# Altium project GTV3.5_Board.PrjPcb (part 12 of 12)

## Sheet Heater_Section.SchDoc
size 420 x 297 mm; DocumentNumber: 11; SheetNumber: 11; SheetTotal: 17
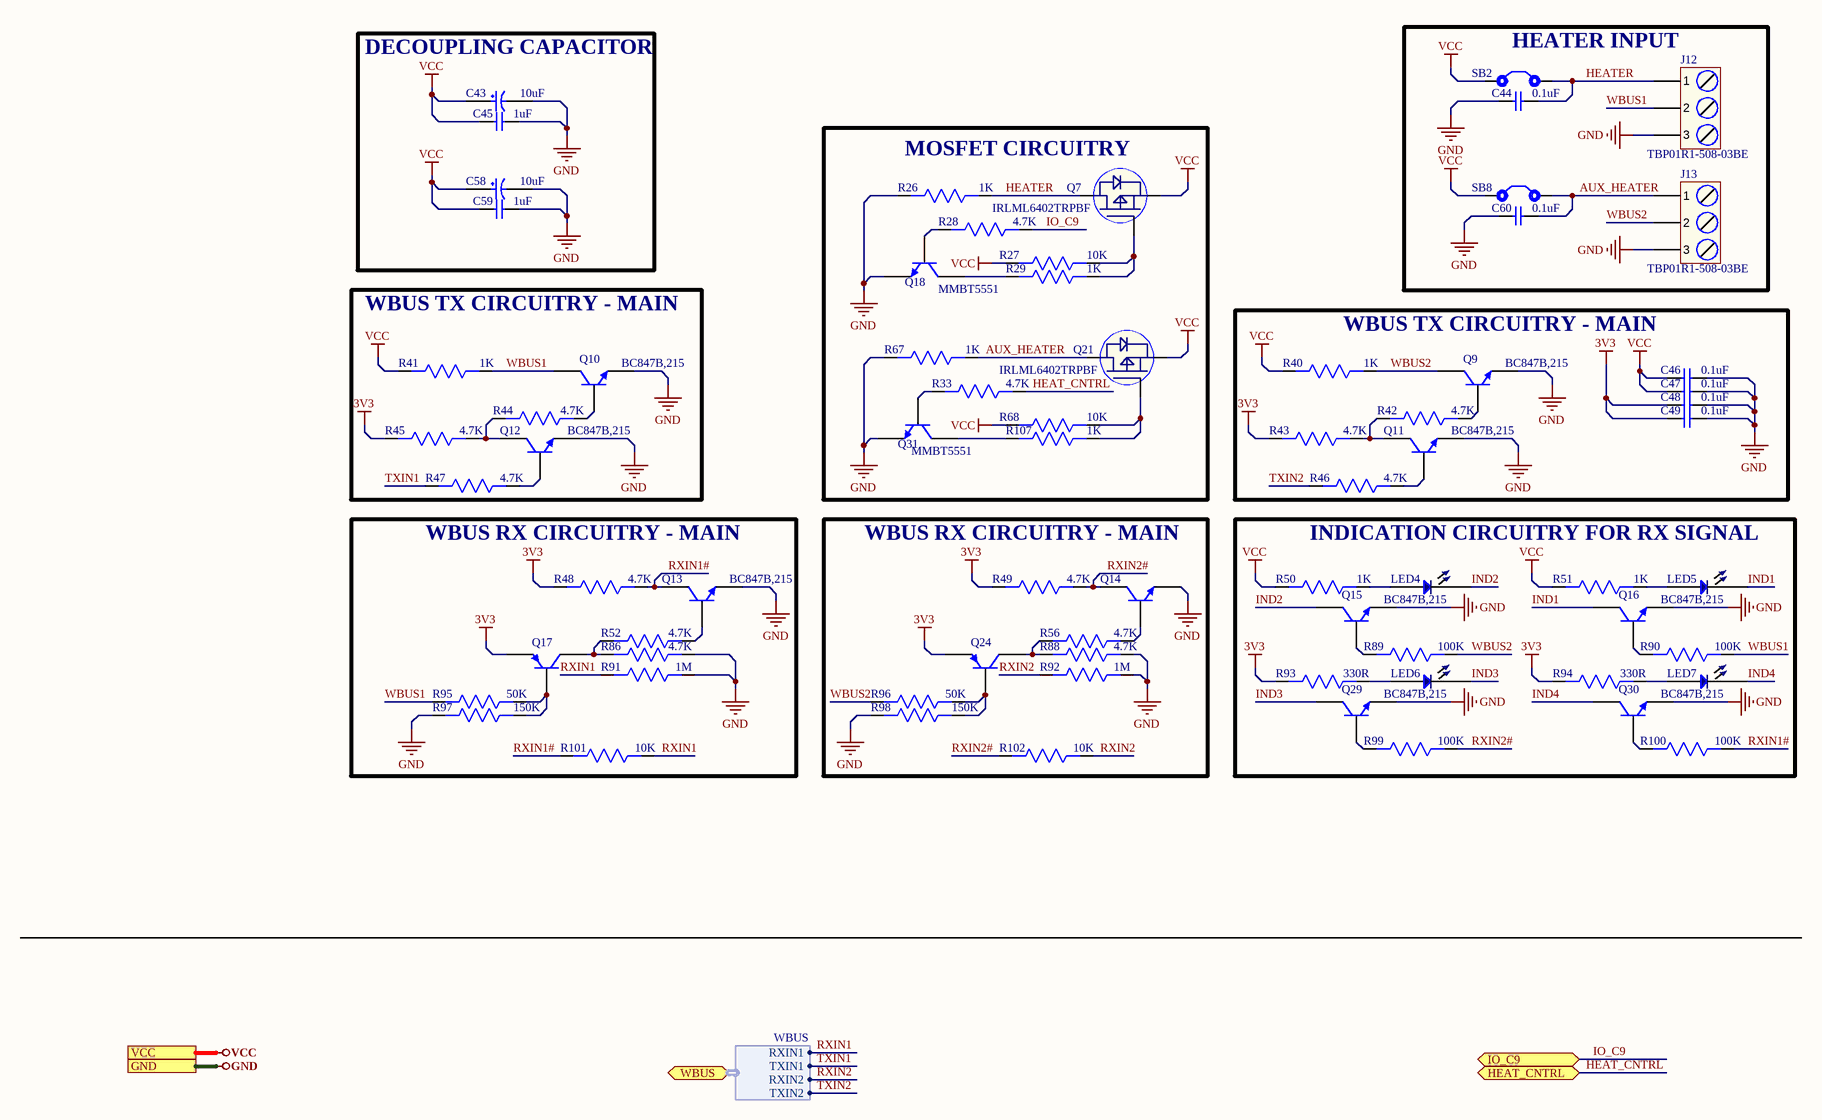
[diagram p21: Heater_Section.SchDoc]

### Parts
C43  10uF  [RVT1E100M0405.]
C44  0.1uF  [Cap0603]
C45  1uF  [Cap0603]
C46  0.1uF  [Cap0603]
C47  0.1uF  [Cap0603]
C48  0.1uF  [Cap0603]
C49  0.1uF  [Cap0603]
C58  10uF  [RVT1E100M0405.]
C59  1uF  [Cap0603]
C60  0.1uF  [Cap0603]
J12  TBP01R1-508-03BE  [TBP01R1-508-03BE]
J13  TBP01R1-508-03BE  [TBP01R1-508-03BE]
LED4  XZMDK68W-2  [LED 0402]  (value not drawn)
LED5  XZMDK68W-2  [LED 0402]  (value not drawn)
LED6  XZMDK68W-2  [LED 0402]  (value not drawn)
LED7  XZMDK68W-2  [LED 0402]  (value not drawn)
Q7  IRLML6402TRPBF  [SOT-23]
Q9  BC847B,215  [SOT-23]
Q10  BC847B,215  [SOT-23]
Q11  BC847B,215  [SOT-23]
Q12  BC847B,215  [SOT-23]
Q13  BC847B,215  [SOT-23]
Q14  BC847B,215  [SOT-23]  (value not drawn)
Q15  BC847B,215  [SOT-23]
Q16  BC847B,215  [SOT-23]
Q17  BC857C,215  [SOT-23]  (value not drawn)
Q18  MMBT5551  [SOT-23]
Q21  IRLML6402TRPBF  [SOT-23]
Q24  BC857C,215  [SOT-23]  (value not drawn)
Q29  BC847B,215  [SOT-23]
Q30  BC847B,215  [SOT-23]
Q31  MMBT5551  [SOT-23]
R26  1K  [RES-0603]
R27  10K  [Res-0603]
R28  4.7K  [RES-0603]
R29  1K  [Res-0603]
R33  4.7K  [RES-0603]
R40  1K  [RES-0603]
R41  1K  [RES-0603]
R42  4.7K  [RES-0603]
R43  4.7K  [RES-0603]
R44  4.7K  [RES-0603]
R45  4.7K  [RES-0603]
R46  4.7K  [RES-0603]
R47  4.7K  [RES-0603]
R48  4.7K  [RES-0603]
R49  4.7K  [RES-0603]
R50  1K  [RES-0603]
R51  1K  [RES-0603]
R52  4.7K  [RES-0603]
R56  4.7K  [RES-0603]
R67  1K  [RES-0603]
R68  10K  [Res-0603]
R86  4.7K  [RES-0603]
R88  4.7K  [RES-0603]
R89  100K  [RES-0603]
R90  100K  [RES-0603]
R91  1M  [RES-0603]
R92  1M  [RES-0603]
R93  330R  [Res-0603]
R94  330R  [Res-0603]
R95  50K  [RES 0805]
R96  50K  [RES 0805]
R97  150K  [RES-0603]
R98  150K  [RES-0603]
R99  100K  [RES-0603]
R100  100K  [RES-0603]
R101  10K  [Res-0603]
R102  10K  [Res-0603]
R107  1K  [Res-0603]
SB2  Solder Bridge  [Solder Bridge]  (value not drawn)
SB8  Solder Bridge  [Solder Bridge]  (value not drawn)

### Blocks framed on the sheet
DECOUPLING CAPACITOR: C43 C45 C58 C59
HEATER INPUT: C44 C60 J12 J13 SB2 SB8
MOSFET CIRCUITRY: Q7 Q18 Q21 Q31 R26-R29 R33 R67 R68 R107
WBUS TX CIRCUITRY - MAIN: Q10 Q12 R41 R44 R45 R47
WBUS TX CIRCUITRY - MAIN: C46-C49 Q9 Q11 R40 R42 R43 R46
WBUS RX CIRCUITRY - MAIN: Q13 Q17 R48 R52 R86 R91 R95 R97 R101
WBUS RX CIRCUITRY - MAIN: Q14 Q24 R49 R56 R88 R92 R96 R98 R102
INDICATION CIRCUITRY FOR RX SIGNAL: LED4-LED7 Q15 Q16 Q29 Q30 R50 R51 R89 R90 R93 R94 R99 R100

### Ports
GND, HEAT_CNTRL (bidir), IO_C9 (bidir), VCC, WBUS (bidir, harness WBUS)

### Harnesses
WBUS: RXIN1, TXIN1, RXIN2, TXIN2

### Nets
3V3: C48.1 C49.1 Q17.2(E) Q24.2(E) R43.2 R45.2 R48.2 R49.2 R93.2 R94.2
GND: C43.2 C44.1 C45.2 C46.2 C47.2 C48.2 C49.2 C58.2 C59.2 C60.1 J12.3 J13.3 Q9.2(E) Q10.2(E) Q11.2(E) Q12.2(E) Q13.2(E) Q14.2(E) Q15.2(E) Q16.2(E) Q18.2(E) Q29.2(E) Q30.2(E) Q31.2(E) R26.2 R67.2 R86.1 R88.1 R91.1 R92.1 R97.2 R98.2 ; port GND
VCC: C43.1 C45.1 C46.1 C47.1 C58.1 C59.1 Q7.2(S) Q21.2(S) R27.2 R40.2 R41.2 R50.2 R51.2 R68.2 SB2.1 SB8.1 ; port VCC
AUX_HEATER: C60.2 J13.1 Q21.3(D) R67.1 SB8.2
HEAT_CNTRL: R33.1 ; port HEAT_CNTRL
HEATER: C44.2 J12.1 Q7.3(D) R26.1 SB2.2
IND1: LED5.2 Q16.3(C)
IND2: LED4.2 Q15.3(C)
IND3: LED6.2 Q29.3(C)
IND4: LED7.2 Q30.3(C)
IO_C9: R28.1 ; port IO_C9
RXIN1: R91.2 R101.1 ; port WBUS.RXIN1
RXIN1#: Q13.3(C) R48.1 R100.1 R101.2
RXIN2: R92.2 R102.1 ; port WBUS.RXIN2
RXIN2#: Q14.3(C) R49.1 R99.1 R102.2
TXIN1: R47.2 ; port WBUS.TXIN1
TXIN2: R46.2 ; port WBUS.TXIN2
WBUS1: J12.2 Q10.3(C) R41.1 R90.1 R95.2
WBUS2: J13.2 Q9.3(C) R40.1 R89.1 R96.2
NetLED4_1: LED4.1 R50.1
NetLED5_1: LED5.1 R51.1
NetLED6_1: LED6.1 R93.1
NetLED7_1: LED7.1 R94.1
NetQ7_1: Q7.1(G) R27.1 R29.1
NetQ9_1: Q9.1(B) R42.1
NetQ10_1: Q10.1(B) R44.1
NetQ11_1: Q11.1(B) R46.1
NetQ11_3: Q11.3(C) R42.2 R43.1
NetQ12_1: Q12.1(B) R47.1
NetQ12_3: Q12.3(C) R44.2 R45.1
NetQ13_1: Q13.1(B) R52.1
NetQ14_1: Q14.1(B) R56.1
NetQ15_1: Q15.1(B) R89.2
NetQ16_1: Q16.1(B) R90.2
NetQ17_1: Q17.1(B) R95.1 R97.1
NetQ17_3: Q17.3(C) R52.2 R86.2
NetQ18_1: Q18.1(B) R28.2
NetQ18_3: Q18.3(C) R29.2
NetQ21_1: Q21.1(G) R68.1 R107.1
NetQ24_1: Q24.1(B) R96.1 R98.1
NetQ24_3: Q24.3(C) R56.2 R88.2
NetQ29_1: Q29.1(B) R99.2
NetQ30_1: Q30.1(B) R100.2
NetQ31_1: Q31.1(B) R33.2
NetQ31_3: Q31.3(C) R107.2

### Notes on the sheet
- File:
- Title:
- Date:
- Page
- Num:
- Total:
- Drawn By: Huzaifa Ali

### Library data of the parts
C43 C58 = RVT1E100M0405: CAP ALUM 10uF 25V SMD; Manufacturer: ROQANG; φD: 4mm; L: 5.4mm; Tolerance: ±20%; Operating Temperature: -45℃~+105℃; Rated Voltage: 25V; Capacitance: 10uF
C44 C46-C49 C60 = CC0603ZRY5V9BB104: as C37 on sheet Switch_Sheet; Supplier 1: Digi-Key; Manufacturer Part Number: CC0603ZRY5V9BB104; Stock 1: 15000880; Pricing 1: 1=0.1, 10=0.075, 100=0.0334, 500=0.02386, 1000=0.01874 (USD); Mount: Surface Mount; Case/Package: 0603; Number of Pins: 2; Case Code (Metric): 1608; Case Code (Imperial): 0603; Min Operating Temperature: -30°C; Max Operating Temperature: 85°C; Dielectric: Y5V; Voltage Rating: 50V; Package Quantity: 1; Packaging: Tape and Reel; Voltage Rating (DC): 50V; Termination: SMD/SMT; Composition: Ceramic; Voltage: 50V; Length: 1.6mm; Height: 0.8mm; Width: 0.031inch; Thickness: 0.035inch; Depth: 0.8mm; Radiation Hardening: No; REACH SVHC: No SVHC; Lead Free: Lead Free; Halogen Free: Halogen Free; ComponentLink1URL: http://www.yageo.com/documents/recent/UPY-GPHC_Y5V_6.3V-to-50V_8.pdf?src-supplier=Digi-Key; ComponentLink1Description: http://www.yageo.com/documents/recent/UPY-GPHC_Y5V_6.3V-to-50V_8.pdf?src-supplier=Digi-Key; ComponentLink2URL: http://www.yageo.com/documents/recent/UPY-GPHC_Y5V_6.3V-to-50V_5.pdf?src-supplier=Avnet+Europe; ComponentLink2Description: http://www.yageo.com/documents/recent/UPY-GPHC_Y5V_6.3V-to-50V_5.pdf?src-supplier=Avnet+Europe; ComponentLink3URL: https://www.verical.com/server-webapp/html/getDatasheet?partID=403611&src-supplier=Verical; ComponentLink3Description: https://www.verical.com/server-webapp/html/getDatasheet?partID=403611&src-supplier=Verical; ComponentLink4URL: http://www.mouser.com/ds/2/447/Yageo_UPY-GP_NP0_16V-to-50V_9-358835.pdf?src-supplier=Mouser; ComponentLink4Description: http://www.mouser.com/ds/2/447/Yageo_UPY-GP_NP0_16V-to-50V_9-358835.pdf?src-supplier=Mouser; ComponentLink5URL: http://www.farnell.com/datasheets/1132289.pdf?src-supplier=Element14; ComponentLink5Description: http://www.farnell.com/datasheets/1132289.pdf?src-supplier=Element14; Supplier Part Number 1: 311-1343-1-ND
C45 C59 = CC0603KRX5R8BB105: CAP CER 1UF 25V X5R 0603; Manufacturer: Yageo; Tolerance: 10%; Supplier 1: Digi-Key; Manufacturer Part Number: CC0603KRX5R8BB105; Stock 1: 1419041; Pricing 1: 1=0.1, 10=0.069, 100=0.0307, 500=0.0219, 1000=0.0172 (USD); Mount: Surface Mount; Case/Package: 0603; Number of Pins: 2; Case Code (Metric): 1608; Case Code (Imperial): 0603; Min Operating Temperature: -55°C; Max Operating Temperature: 85°C; Capacitance: 1uF; Dielectric: X5R; Package Quantity: 1; Voltage Rating: 25V; Packaging: Tape and Reel; Termination: SMD/SMT; Voltage Rating (DC): 25V; Length: 1.6mm; Height: 0.8mm; Width: 0.031inch; Thickness: 0.035inch; Depth: 0.8mm; Radiation Hardening: No; REACH SVHC: No SVHC; Lead Free: Lead Free; Halogen Free: Halogen Free; ComponentLink1URL: http://www.yageo.com/documents/recent/UPY-GPHC_X5R_4V-to-50V_25.pdf?src-supplier=Digi-Key; ComponentLink1Description: http://www.yageo.com/documents/recent/UPY-GPHC_X5R_4V-to-50V_25.pdf?src-supplier=Digi-Key; ComponentLink2URL: http://www.yageo.com/documents/recent/UPY-GPHC_X5R_4V-to-50V_12.pdf?src-supplier=Avnet+Europe; ComponentLink2Description: http://www.yageo.com/documents/recent/UPY-GPHC_X5R_4V-to-50V_12.pdf?src-supplier=Avnet+Europe; ComponentLink3URL: http://www.farnell.com/datasheets/1525783.pdf?src-supplier=Element14; ComponentLink3Description: http://www.farnell.com/datasheets/1525783.pdf?src-supplier=Element14; ComponentLink4URL: http://www.yageo.com/documents/recent/UPY-GPHC_X5R_4V-to-50V_12.pdf?src-supplier=Avnet; ComponentLink4Description: http://www.yageo.com/documents/recent/UPY-GPHC_X5R_4V-to-50V_12.pdf?src-supplier=Avnet; Supplier Part Number 1: 311-1445-6-ND
J12 J13 = TBP01R1-508-03BE: TERMINAL BLOCK, PLUGGABLE, 5.08,; Manufacturer: CUI Devices; Supplier 1: Arrow Electronics; Manufacturer Part Number: TBP01R1-508-03BE; RoHS: Yes; Category: Terminal Blocks; Stock 1: 2069; Pricing 1: 1=0.52380, 10=0.21370, 100=0.18450, 600=0.17070 (USD); Supplier Part Number 1: TBP01R1-508-03BE
LED4-LED7 = XZMDK68W-2: LED RED CLEAR CHIP SMD; Manufacturer: SunLED; Lens Color: Colorless; Luminous Intensity: 69mcd; Test Current: 20mA; Viewing Angle: 120°; Dominant Wavelength: 630nm; Forward Voltage: 1.95V; Supplier 1: Digi-Key; Manufacturer Part Number: XZMDK68W-2; Stock 1: 69539; Pricing 1: 1=0.43, 10=0.306, 100=0.136, 500=0.0952, 1000=0.0782 (USD); Mount: Surface Mount; Case/Package: 0402; Color: Red; Case Code (Metric): 1005; Case Code (Imperial): 0402; Packaging: Tape and Reel; Lens Transparency: Clear; Length: 1mm; Height: 0.6mm; Width: 0.5mm; ComponentLink1URL: http://www.sunledusa.com/products/spec/XZMDK68W-2.pdf?src-supplier=Digi-Key; ComponentLink1Description: http://www.sunledusa.com/products/spec/XZMDK68W-2.pdf?src-supplier=Digi-Key; ComponentLink2URL: https://www.sunledusa.com/products/spec/XZMDK68W-2.pdf?src-supplier=Digi-Key; ComponentLink2Description: https://www.sunledusa.com/products/spec/XZMDK68W-2.pdf?src-supplier=Digi-Key; Supplier Part Number 1: 1497-1174-6-ND
Q7 Q21 = IRLML6402TRPBF: MOSFET P-CH 20V 3.7A SOT23; Manufacturer: International Rectifier; Rise Time: 48ns; Gate to Source Voltage (Vgs): 12V; Turn-On Delay Time: 350ns; Turn-Off Delay Time: 588ns; Fall Time: 381ns; Nominal Vgs: -550mV; Rds On Max: 65mR; Input Capacitance: 633pF; Max Power Dissipation: 1.3W; Number of Elements: 1; Dual Supply Voltage: -20V; Element Configuration: Single; Current Rating: -3.7A; Supplier 1: Newark; Manufacturer Part Number: IRLML6402TRPBF; RoHS: Yes; Category: MOSFETs; Mount: Surface Mount; Case/Package: SOT-23; Number of Pins: 3; Min Operating Temperature: -55°C; Max Operating Temperature: 150°C; Drain to Source Voltage (Vdss): 20V; Continuous Drain Current (ID): 3.7A; Package Quantity: 1; Packaging: Tape and Reel; Drain to Source Resistance: 65mR; Power Dissipation: 1.3W; Threshold Voltage: -550mV; Termination: SMD/SMT; Drain to Source Breakdown Voltage: -20V; Voltage Rating (DC): -20V; On-State Resistance: 65mR; Series: HEXFET®; Drain-source On Resistance-Max: 65mR; Length: 3.04mm; Width: 1.4mm; Height: 1.02mm; Radiation Hardening: No; Lead Free: Lead Free; RoHS Compliant: Yes; REACH SVHC: No SVHC; ComponentLink1URL: https://datasheet.ciiva.com/7799/13209-7799017.pdf?src-supplier=Element14; ComponentLink1Description: https://datasheet.ciiva.com/7799/13209-7799017.pdf?src-supplier=Element14; ComponentLink2URL: https://datasheet.ciiva.com/34302/1563729-34302500.pdf?src-supplier=Jameco; ComponentLink2Description: https://datasheet.ciiva.com/34302/1563729-34302500.pdf?src-supplier=Jameco; ComponentLink3URL: https://datasheet.ciiva.com/28515/irlml6402pbf-28515795.pdf?src-supplier=Element14; ComponentLink3Description: https://datasheet.ciiva.com/28515/irlml6402pbf-28515795.pdf?src-supplier=Element14; ComponentLink4URL: https://datasheet.ciiva.com/7333/irlml6402-7333200.pdf?src-supplier=Newark; ComponentLink4Description: https://datasheet.ciiva.com/7333/irlml6402-7333200.pdf?src-supplier=Newark; ComponentLink5URL: https://datasheet.ciiva.com/29326/162833-da-01-en-irlml-6402tr-29326798.pdf?src-supplier=Conrad; ComponentLink5Description: https://datasheet.ciiva.com/29326/162833-da-01-en-irlml-6402tr-29326798.pdf?src-supplier=Conrad; ComponentLink6URL: https://datasheet.ciiva.com/7799/13209-7799018.pdf?src-supplier=Element14; ComponentLink6Description: https://datasheet.ciiva.com/7799/13209-7799018.pdf?src-supplier=Element14; ComponentLink7URL: https://datasheet.ciiva.com/936/irlml6402pbf-936987.pdf?src-supplier=Digi-Key; ComponentLink7Description: https://datasheet.ciiva.com/936/irlml6402pbf-936987.pdf?src-supplier=Digi-Key; ComponentLink8URL: https://datasheet.ciiva.com/936/irlml6402pbf-936988.pdf?src-supplier=Digi-Key; ComponentLink8Description: https://datasheet.ciiva.com/936/irlml6402pbf-936988.pdf?src-supplier=Digi-Key; ComponentLink9URL: https://datasheet.ciiva.com/16311/irlml6402pbf-16311535.pdf?src-supplier=Future+Electronics; ComponentLink9Description: https://datasheet.ciiva.com/16311/irlml6402pbf-16311535.pdf?src-supplier=Future+Electronics; Supplier Part Number 1: 06X2796
Q9-Q16 Q29 Q30 = BC847B,215: NPN Ic=100mA Vceo=45V hfe=200~450 P=250mW; Manufacturer: Nexperia; Supplier 1: Arrow Electronics; Manufacturer Part Number: BC847B,215; RoHS: Yes; Category: BJTs; Stock 1: 29122; Pricing 1: 1=0.09880, 10=0.09780, 25=0.08510, 100=0.03610, 250=0.03050, 500=0.03020, 1000=0.01780, 3000=0.01760, 15000=0.01740 (USD); RoHS Compliant: Yes; ComponentLink1URL: http://www.farnell.com/datasheets/1856333.pdf?src-supplier=Farnell; ComponentLink1Description: http://www.farnell.com/datasheets/1856333.pdf?src-supplier=Farnell; ComponentLink2URL: https://assets.nexperia.com/documents/data-sheet/BC847_SER.pdf?src-supplier=Digi-Key; ComponentLink2Description: https://assets.nexperia.com/documents/data-sheet/BC847_SER.pdf?src-supplier=Digi-Key; ComponentLink3URL: http://www.farnell.com/datasheets/1856333.pdf?src-supplier=Newark; ComponentLink3Description: http://www.farnell.com/datasheets/1856333.pdf?src-supplier=Newark; Supplier Part Number 1: BC847B,215
Q17 Q24 = BC857C,215: PNP Ic=-100mA Vceo=-45V hfe=420~800 P=250mW; Manufacturer: Nexperia; Supplier 1: Arrow Electronics; Manufacturer Part Number: BC857C,215; RoHS: Yes; Stock 1: 72007; Pricing 1: 1=0.10380, 10=0.09690, 25=0.09560, 100=0.06510, 250=0.04590, 500=0.03870, 1000=0.02580, 3000=0.01620, 15000=0.01600, 30000=0.01420 (USD); RoHS Compliant: Yes; ComponentLink1URL: http://www.farnell.com/datasheets/490737.pdf?src-supplier=Farnell; ComponentLink1Description: http://www.farnell.com/datasheets/490737.pdf?src-supplier=Farnell; ComponentLink2URL: https://assets.nexperia.com/documents/data-sheet/BC856_BC857_BC858.pdf?src-supplier=Digi-Key; ComponentLink2Description: https://assets.nexperia.com/documents/data-sheet/BC856_BC857_BC858.pdf?src-supplier=Digi-Key; ComponentLink3URL: http://www.semiconductors.philips.com/acrobat/datasheets/BC856_BC857_BC858_6.pdf?src-supplier=Newark; ComponentLink3Description: http://www.semiconductors.philips.com/acrobat/datasheets/BC856_BC857_BC858_6.pdf?src-supplier=Newark; Supplier Part Number 1: BC857C,215
Q18 Q31 = MMBT5551: TRANS NPN 160V 0.6A SOT-23; Manufacturer: ON Semiconductor; Manufacturer Part Number: MMBT5551LT1G; Max Power Dissipation: 225mW; Max Collector Current: 600mA; Collector Base Voltage (VCBO): 180V; Emitter Base Voltage (VEBO): 6V; Element Configuration: Single; hFE Min: 80; Power Dissipation: 300mW; Number of Elements: 1; Collector Emitter Saturation Voltage: 150mV; Collector-emitter Voltage-Max: 200mV; Supplier 1: Digi-Key; RoHS: Yes; Category: BJTs; Pricing 1: 1=0.22000, 10=0.17700, 100=0.09370, 500=0.06162, 1000=0.04190 (USD); Case/Package: SOT-23-3; Number of Pins: 3; Weight: 0.01lb; Contact Plating: Tin,Matte; Min Operating Temperature: -55°C; Max Operating Temperature: 150°C; Packaging: Tape and Reel; Collector Emitter Voltage (VCEO): 160V; Polarity: NPN; Package Quantity: 1; Collector Emitter Breakdown Voltage: 160V; Current Rating: 600mA; Voltage Rating (DC): 160V; Max Breakdown Voltage: 160V; Series: -; Length: 2.9mm; Width: 1.3mm; Height: 0.94mm; Radiation Hardening: No; Lead Free: Lead Free; REACH SVHC: No SVHC; RoHS Compliant: Yes; ComponentLink1URL: https://datasheet.ciiva.com/976/mmbt5550lt1-d-976512.pdf?src-supplier=Digi-Key; ComponentLink1Description: https://datasheet.ciiva.com/976/mmbt5550lt1-d-976512.pdf?src-supplier=Digi-Key; ComponentLink2URL: https://datasheet.ciiva.com/34303/2011387-34303825.pdf?src-supplier=Jameco; ComponentLink2Description: https://datasheet.ciiva.com/34303/2011387-34303825.pdf?src-supplier=Jameco; ComponentLink3URL: https://datasheet.ciiva.com/15139/getdatasheetpartid-92641-15139178.pdf?src-supplier=Verical; ComponentLink3Description: https://datasheet.ciiva.com/15139/getdatasheetpartid-92641-15139178.pdf?src-supplier=Verical; ComponentLink4URL: https://datasheet.ciiva.com/16984/0900766b8078eb1b-16984971.pdf?src-supplier=Allied+Electronics; ComponentLink4Description: https://datasheet.ciiva.com/16984/0900766b8078eb1b-16984971.pdf?src-supplier=Allied+Electronics; ComponentLink5URL: https://datasheet.ciiva.com/976/mmbt5550lt1-d-976513.pdf?src-supplier=Digi-Key; ComponentLink5Description: https://datasheet.ciiva.com/976/mmbt5550lt1-d-976513.pdf?src-supplier=Digi-Key; ComponentLink6URL: https://datasheet.ciiva.com/4722/mmbt5550lt1-d-111393-4722711.pdf?src-supplier=Mouser; ComponentLink6Description: https://datasheet.ciiva.com/4722/mmbt5550lt1-d-111393-4722711.pdf?src-supplier=Mouser; ComponentLink7URL: https://datasheet.ciiva.com/16478/mmbt5550lt1-d-16478568.pdf?src-supplier=Avnet+Asia; ComponentLink7Description: https://datasheet.ciiva.com/16478/mmbt5550lt1-d-16478568.pdf?src-supplier=Avnet+Asia; ComponentLink8URL: https://datasheet.ciiva.com/7972/mmbt5550lt1-d-7972073.pdf?src-supplier=Element14; ComponentLink8Description: https://datasheet.ciiva.com/7972/mmbt5550lt1-d-7972073.pdf?src-supplier=Element14; ComponentLink9URL: https://datasheet.ciiva.com/25997/mmbt5550lt1-d-25997449.pdf?src-supplier=Avnet+Europe; ComponentLink9Description: https://datasheet.ciiva.com/25997/mmbt5550lt1-d-25997449.pdf?src-supplier=Avnet+Europe; ComponentLink10URL: https://datasheet.ciiva.com/7972/mmbt5550lt1-d-7972075.pdf?src-supplier=Element14; ComponentLink10Description: https://datasheet.ciiva.com/7972/mmbt5550lt1-d-7972075.pdf?src-supplier=Element14; ComponentLink11URL: https://datasheet.ciiva.com/11197/mmbt5550lt1-d-11197404.pdf?src-supplier=Avnet; ComponentLink11Description: https://datasheet.ciiva.com/11197/mmbt5550lt1-d-11197404.pdf?src-supplier=Avnet; ComponentLink12URL: https://datasheet.ciiva.com/976/mmbt5550lt1-d-976511.pdf?src-supplier=Digi-Key; ComponentLink12Description: https://datasheet.ciiva.com/976/mmbt5550lt1-d-976511.pdf?src-supplier=Digi-Key; ComponentLink13URL: https://datasheet.ciiva.com/16342/mmbt5550lt1-d-16342687.pdf?src-supplier=Future+Electronics; ComponentLink13Description: https://datasheet.ciiva.com/16342/mmbt5550lt1-d-16342687.pdf?src-supplier=Future+Electronics; Supplier Part Number 1: MMBT5551LT1GOSDKR-ND
R26 R40 R41 R50 R51 R67 = RC0603FR-071KL: RES SMD 1K OHM 1% 1/10W 0603; Manufacturer: Yageo; Resistance: 1kR; Temperature Coefficient: 100ppm/°C; Power Rating: 100mW; Voltage Rating: 50V; ComponentLink1URL: https://www.verical.com/server-webapp/html/getDatasheet?partID=409289&src-supplier=Verical; ComponentLink1Description: https://www.verical.com/server-webapp/html/getDatasheet?partID=409289&src-supplier=Verical; Supplier 1: Digi-Key; Manufacturer Part Number: RC0603FR-071KL; Stock 1: 21472395; Pricing 1: 1=0.1, 10=0.023, 100=0.0094, 1000=0.0042, 2500=0.0037 (USD); Case/Package: 0603; Contact Plating: Tin,Matte; Case Code (Imperial): 0603; Case Code (Metric): 1608; Min Operating Temperature: -55°C; Max Operating Temperature: 155°C; Tolerance: 1%; Composition: Thick Film; Packaging: Tape and Reel; Termination: SMD/SMT; Military Standard: Not; Length: 1.6mm; Height: 0.45mm; Depth: 0.8mm; Radiation Hardening: No; REACH SVHC: No SVHC; Lead Free: Lead Free; ComponentLink2URL: http://documents.rs-components.com/techlib://itc_doclist_GB.htm?stockno=5048928&src-supplier=RSComponents; ComponentLink2Description: http://documents.rs-components.com/techlib://itc_doclist_GB.htm?stockno=5048928&src-supplier=RSComponents; ComponentLink3URL: http://www.yageo.com/documents/recent/PYu-RC0603_51_RoHS_L_4.pdf?src-supplier=Avnet+Europe; ComponentLink3Description: http://www.yageo.com/documents/recent/PYu-RC0603_51_RoHS_L_4.pdf?src-supplier=Avnet+Europe; ComponentLink4URL: http://www.farnell.com/datasheets/2167052.pdf?src-supplier=Element14; ComponentLink4Description: http://www.farnell.com/datasheets/2167052.pdf?src-supplier=Element14; ComponentLink5URL: http://www.farnell.com/datasheets/1868787.pdf?src-supplier=Element14; ComponentLink5Description: http://www.farnell.com/datasheets/1868787.pdf?src-supplier=Element14; ComponentLink6URL: http://www.yageo.com/documents/recent/PYu-RC_Group_51_RoHS_L_2.pdf?src-supplier=Avnet; ComponentLink6Description: http://www.yageo.com/documents/recent/PYu-RC_Group_51_RoHS_L_2.pdf?src-supplier=Avnet; ComponentLink7URL: https://www.verical.com/server-webapp/html/getDatasheet?partID=404327&src-supplier=Verical; ComponentLink7Description: https://www.verical.com/server-webapp/html/getDatasheet?partID=404327&src-supplier=Verical; ComponentLink8URL: http://www.farnell.com/datasheets/443971.pdf?src-supplier=Element14; ComponentLink8Description: http://www.farnell.com/datasheets/443971.pdf?src-supplier=Element14; Supplier Part Number 1: 311-1.00KHRDKR-ND
R27 R68 R101 R102 = RC0603FR-0710KL: as R72 on sheet LED_Section; Supplier 1: Digi-Key; Manufacturer Part Number: RC0603FR-0710KL; RoHS: Yes; Category: Chip SMD Resistors; Stock 1: 25249139; Pricing 1: 1=0.10000, 10=0.02400, 100=0.00970, 1000=0.00436, 2500=0.00378 (USD); Case/Package: 0603; Case Code (Imperial): 0603; Case Code (Metric): 1608; Size Code: 0603; Min Operating Temperature: -55°C; Max Operating Temperature: 155°C; Packaging: Tape and Reel; Tolerance: 1%; Resistor Type: Thick Film; Termination: SMD/SMT; Number of Terminations: 2; Max Power Dissipation: 100mW; Features: Moisture Resistant; Series: RC; Construction: Rectangular; Length: 1.6mm; Width: 0.8mm; Height: 0.45mm; Depth: 0.8mm; Military Standard: Not; Lead Free: Lead Free; RoHS Compliant: Yes; ComponentLink1URL: https://datasheet.ciiva.com/7660/38590-7660789.pdf?src-supplier=Element14; ComponentLink1Description: https://datasheet.ciiva.com/7660/38590-7660789.pdf?src-supplier=Element14; Supplier Part Number 1: 311-10.0KHRCT-ND; Number of Pins: 2; Weight: 7.1E-05oz; Resistance Tolerance: 1%; Lead Pitch: 0.3mm; REACH SVHC: Unknown; ComponentLink2URL: https://datasheet.ciiva.com/7983/443971-7983596.pdf?src-supplier=Element14; ComponentLink2Description: https://datasheet.ciiva.com/7983/443971-7983596.pdf?src-supplier=Element14; ComponentLink3URL: https://datasheet.ciiva.com/22747/443971-22747519.pdf?src-supplier=Element14; ComponentLink3Description: https://datasheet.ciiva.com/22747/443971-22747519.pdf?src-supplier=Element14; ComponentLink4URL: https://datasheet.ciiva.com/46440/1868787-46440891.pdf?src-supplier=Element14; ComponentLink4Description: https://datasheet.ciiva.com/46440/1868787-46440891.pdf?src-supplier=Element14; ComponentLink5URL: https://datasheet.ciiva.com/7746/1738695-7746239.pdf?src-supplier=Element14; ComponentLink5Description: https://datasheet.ciiva.com/7746/1738695-7746239.pdf?src-supplier=Element14; ComponentLink6URL: https://datasheet.ciiva.com/15189/getdatasheetpartid-409289-15189591.pdf?src-supplier=Verical; ComponentLink6Description: https://datasheet.ciiva.com/15189/getdatasheetpartid-409289-15189591.pdf?src-supplier=Verical; LCSC Part Number: C98220
R28 R33 R42-R49 R52 R56 R86 R88 = RC0603FR-074K7L: RES SMD 4.7K OHM 1% 1/10W 0603; Manufacturer: Yageo; Resistance: 4.7kR; Temperature Coefficient: 100ppm/°C; Voltage Rating (DC): 50V; Power Rating: 100mW; Supplier 1: Digi-Key; Manufacturer Part Number: RC0603FR-074K7L; Stock 1: 1924316; Pricing 1: 1=0.10000, 10=0.02400, 100=0.00970, 1000=0.00436, 2500=0.00378 (USD); Case/Package: 0603; Number of Pins: 2; Case Code (Imperial): 0603; Case Code (Metric): 1608; Min Operating Temperature: -55°C; Max Operating Temperature: 155°C; Tolerance: 1%; Packaging: Tape and Reel; Voltage Rating: 50V; Termination: SMD/SMT; Military Standard: Not; Length: 1.6mm; Width: 0.8mm; Depth: 0.8mm; REACH SVHC: No SVHC; Lead Free: Lead Free; ComponentLink1URL: https://datasheet.ciiva.com/15189/getdatasheetpartid-422754-15189760.pdf?src-supplier=Verical; ComponentLink1Description: https://datasheet.ciiva.com/15189/getdatasheetpartid-422754-15189760.pdf?src-supplier=Verical; Supplier Part Number 1: 311-4.70KHRCT-ND; RoHS: Yes; Category: Chip SMD Resistors; Size Code: 0603; Resistor Type: Thick Film; Features: Moisture Resistant; Series: RC; Max Power Dissipation: 100mW; Number of Terminations: 2; Construction: Rectangular; Resistance Tolerance: 1%; Height: 0.45mm; Lead Pitch: 0.3mm; RoHS Compliant: Yes; ComponentLink2URL: https://datasheet.ciiva.com/22747/443971-22747528.pdf?src-supplier=Element14; ComponentLink2Description: https://datasheet.ciiva.com/22747/443971-22747528.pdf?src-supplier=Element14; ComponentLink3URL: https://datasheet.ciiva.com/7660/38590-7660794.pdf?src-supplier=Element14; ComponentLink3Description: https://datasheet.ciiva.com/7660/38590-7660794.pdf?src-supplier=Element14; ComponentLink4URL: https://datasheet.ciiva.com/7746/1868787-7746365.pdf?src-supplier=Element14; ComponentLink4Description: https://datasheet.ciiva.com/7746/1868787-7746365.pdf?src-supplier=Element14; ComponentLink5URL: https://datasheet.ciiva.com/46440/1868787-46440909.pdf?src-supplier=Element14; ComponentLink5Description: https://datasheet.ciiva.com/46440/1868787-46440909.pdf?src-supplier=Element14; ComponentLink6URL: https://datasheet.ciiva.com/7746/1738695-7746366.pdf?src-supplier=Element14; ComponentLink6Description: https://datasheet.ciiva.com/7746/1738695-7746366.pdf?src-supplier=Element14
R29 R107 = RC0603JR-071KL: RES SMD 1K 0.1W 0603  75 V, Thick Film; Manufacturer: Yageo; Resistance: 1kR; Tolerance: 5%; Temperature Coefficient: 100ppm/°C; Voltage Rating (DC): 50V; Power Rating: 100mW; Body Length: 1.6mm; Supplier 1: Digi-Key; Manufacturer Part Number: RC0603JR-071KL; RoHS: Yes; Category: Chip SMD Resistors; Stock 1: 1727570; Pricing 1: 1=0.10000, 10=0.02000, 100=0.00800, 1000=0.00360, 2500=0.00312 (USD); Case/Package: 0603; Number of Pins: 2; Contact Plating: Tin,Matte; Case Code (Imperial): 0603; Case Code (Metric): 1608; Size Code: 0603; Min Operating Temperature: -55°C; Max Operating Temperature: 155°C; Resistor Type: Thick Film; Packaging: Tape and Reel; Package Quantity: 5000; Voltage Rating: 50V; Termination: SMD/SMT; Series: RC; Resistance Tolerance: 5%; Construction: Rectangular; Length: 1.6mm; Width: 0.8mm; Height: 0.45mm; Depth: 0.8mm; Radiation Hardening: No; REACH SVHC: Unknown; Lead Free: Lead Free; Military Standard: Not; RoHS Compliant: Yes; Supplier Part Number 1: 311-1.0KGRCT-ND; LCSC Part Number: C14676
R89 R90 R99 R100 = RC0603FR-07100KL: RES 100K OHM 1% 1/10W 0603; Manufacturer: Yageo; Resistance: 100kR; Temperature Coefficient: 100ppm/°C; Voltage Rating (DC): 50V; Power Rating: 100mW; Working Voltage: 75V; Supplier 1: Digi-Key; Manufacturer Part Number: RC0603FR-07100KL; RoHS: Yes; Category: Chip SMD Resistors; Stock 1: 4230938; Pricing 1: 1=0.10000, 10=0.02400, 100=0.00970, 1000=0.00436, 2500=0.00378 (USD); Case/Package: 0603; Number of Pins: 2; Case Code (Imperial): 0603; Case Code (Metric): 1608; Min Operating Temperature: -55°C; Max Operating Temperature: 155°C; Tolerance: 1%; Resistor Type: Thick Film; Packaging: Tape and Reel; Voltage Rating: 50V; Termination: SMD/SMT; Number of Terminations: 2; Features: Moisture Resistant; Series: RC; Max Power Dissipation: 100mW; Resistance Tolerance: 1%; Construction: Rectangular; Technology: THICK FILM; Length: 1.6mm; Width: 0.8mm; Height: 0.45mm; Depth: 0.8mm; REACH SVHC: No SVHC; Lead Free: Lead Free; Military Standard: Not; RoHS Compliant: Yes; Supplier Part Number 1: 311-100KHRCT-ND
R91 R92 = RC0603FR-071ML: Res SMD 0603 1M Ohm 1% 1/10W ±100ppm/°C Molded SMD Paper T/R; Manufacturer: Yageo; Voltage Rating: 75V; Voltage Rating (DC): 50V; Resistance: 1MR; Power Rating: 100mW; Application(s): HIGH RELIABILITY; Supplier 1: Arrow Electronics; Manufacturer Part Number: RC0603FR-071ML; RoHS: Yes; Category: Chip SMD Resistors; Stock 1: 440000; Pricing 1: 5000=0.00200, 25000=0.00190 (USD); Case/Package: 0603; Number of Pins: 2; Case Code (Imperial): 0603; Case Code (Metric): 1608; Weight: 0.000847oz; Min Operating Temperature: -55°C; Max Operating Temperature: 155°C; Tolerance: 1%; Packaging: Cut Tape; Package Quantity: 5000; Termination: SMD/SMT; Resistor Type: Thick Film; Temperature Coefficient: 100ppm/°C; Type: General Purpose; Series: RC; Technology: THICK FILM; Length: 1.6mm; Width: 0.8mm; Height: 0.45mm; Depth: 0.8mm; RoHS Compliant: Yes; REACH SVHC: No SVHC; Military Standard: Not; Lead Free: Lead Free; ComponentLink1URL: https://datasheet.ciiva.com/11819/0900766b80f96399-11819295.pdf?src-supplier=RSComponents; ComponentLink1Description: https://datasheet.ciiva.com/11819/0900766b80f96399-11819295.pdf?src-supplier=RSComponents; ComponentLink2URL: https://datasheet.ciiva.com/7983/443971-7983614.pdf?src-supplier=Element14; ComponentLink2Description: https://datasheet.ciiva.com/7983/443971-7983614.pdf?src-supplier=Element14; ComponentLink3URL: https://datasheet.ciiva.com/12555/rc0603-272842-12555388.pdf?src-supplier=Mouser; ComponentLink3Description: https://datasheet.ciiva.com/12555/rc0603-272842-12555388.pdf?src-supplier=Mouser; Supplier Part Number 1: RC0603FR-071ML
R93 R94 = RC0603JR-07330RL: RES  SMD 330R 100 mW 0603; Manufacturer: Yageo; Power Rating: 100mW; Tolerance: 5%; Voltage Rating (DC): 50V; Temperature Coefficient: 100ppm/°C; Supplier 1: Digi-Key; Manufacturer Part Number: RC0603JR-07330RL; RoHS: Yes; Category: Chip SMD Resistors; Stock 1: 1074593; Pricing 1: 1=0.10000, 10=0.02000, 100=0.00800, 1000=0.00360, 2500=0.00312 (USD); Case/Package: 0603; Number of Pins: 2; Case Code (Imperial): 0603; Case Code (Metric): 1608; Size Code: 0603; Min Operating Temperature: -55°C; Max Operating Temperature: 155°C; Resistance: 330R; Packaging: Tape and Reel; Voltage Rating: 50V; Package Quantity: 5000; Termination: SMD/SMT; Resistor Type: Thick Film; Features: Moisture Resistant; Series: RC; Max Power Dissipation: 100mW; Number of Terminations: 2; Resistance Tolerance: 5%; Construction: Rectangular; Length: 1.6mm; Width: 0.8mm; Height: 0.45mm; Depth: 0.8mm; REACH SVHC: No SVHC; Lead Free: Lead Free; Military Standard: Not; RoHS Compliant: Yes; Supplier Part Number 1: 311-330GRCT-ND; LCSC Part Number: C105879
R95 R96 = ARG05DTC5002: RES SMD 50K ±0.5% ±25ppm/℃ 0805; Manufacturer: Viking Tech; Overload Voltage (Max): 150V; Package: 0805; ComponentLink1Description: LCSC; ComponentLink1URL: https://lcsc.com/product-detail/Chip-span-style-background-color-ff0-Resistor-span-Surface-Mount_Viking-Tech-ARG05DTC5002_C2828840.html; Resistance: 50K; Operating Temperature Range: -55℃~+155℃; Temperature Coefficient: ±25ppm/℃
R97 R98 = RC0603FR-07150KL: Res SMD 0603 150K Ohm 1% 0.1W(1/10W) ±100ppm/C Pad SMD T/R; Manufacturer: Yageo; Resistance: 150kR; Voltage Rating (DC): 50V; Temperature Coefficient: 100ppm/°C; Power Rating: 100mW; Supplier 1: Arrow Electronics; Manufacturer Part Number: RC0603FR-07150KL; RoHS: Yes; Category: Chip SMD Resistors; Stock 1: 3850; Pricing 1: 1=0.04270, 10=0.02380, 25=0.02180, 100=0.00710, 250=0.00700, 500=0.00620, 1000=0.00400, 3000=0.00390 (USD); Case/Package: 0603; Number of Pins: 2; Case Code (Metric): 1608; Case Code (Imperial): 0603; Size Code: 0603; Min Operating Temperature: -55°C; Max Operating Temperature: 155°C; Tolerance: 1%; Packaging: Tape and Reel; Resistor Type: Thick Film; Package Quantity: 1; Voltage Rating: 50V; Number of Terminations: 2; Termination: SMD/SMT; Max Power Dissipation: 100mW; Features: Moisture Resistant; Series: RC; Resistance Tolerance: 1%; Construction: Rectangular; Length: 0.063inch; Width: 0.031inch; Height: 0.022inch; Depth: 0.8mm; REACH SVHC: No SVHC; Lead Free: Lead Free; RoHS Compliant: Yes; Military Standard: Not; Supplier Part Number 1: RC0603FR-07150KL
SB2 SB8 = Solder Bridge: Solder Bridge ON

## Nets that join several sheets
3V3: Regulator_Section (5 pins), Connector_Section (8 pins), SD-Card-Sheet (8 pins), Valve_Section (C135.2 U31.5), Temperature_Sense_Section (25 pins), Sensor_Section (R23.2 R35.2 R76.2 R79.2), Switch_Sheet (R18.2 R19.2), HMI_Encoder_NFC_Sheet (J24.5), Ultra_Sonic_Section (7 pins), Heater_Section (10 pins)
3V3_MCU: Regulator_Section (7 pins), Controller_Section (33 pins), GSM_Sheet (C104.1 C106.1 U23.7 U26.7), WIFI_Sheet (Q28.2 R186.1), Valve_Section (R176.2 R177.2), LED_Section (Q26.1 R73.1)
3V3_WIFI: Regulator_Section (5 pins), WIFI_Sheet (C141.2 J33.1)
5V: Current_Sense_Section (6 pins), Regulator_Section (10 pins), Connector_Section (J19.1 R21.2 SB43.1), Receiver_Section (C71.2 U29.5), Gate_Driver_Section (6 pins), HMI_Encoder_NFC_Sheet (J23.4)
5V-LED: Regulator_Section (5 pins), LED_Section (J18.1 R74.1)
BAT: Reverse Protection_Section (C2.2 J2.1 R149.2), Solar_Charge_Controller (7 pins)
GND: Current_Sense_Section (12 pins), Voltage_Monitoring_Section (5 pins), Regulator_Section (44 pins), Reverse Protection_Section (5 pins), Solar_Charge_Controller (11 pins), Connector_Section (28 pins), Receiver_Section (15 pins), Controller_Section (37 pins), GSM_Sheet (87 pins), SD-Card-Sheet (13 pins), WIFI_Sheet (5 pins), Valve_Section (38 pins), Temperature_Sense_Section (36 pins), Sensor_Section (8 pins), Gate_Driver_Section (9 pins), Switch_Sheet (C37.1 C38.1 SW1.1 SW2.1), LED_Section (J18.3 Q25.2 R72.2), HMI_Encoder_NFC_Sheet (6 pins), Ultra_Sonic_Section (6 pins), Heater_Section (32 pins)
GSM_PWR: Regulator_Section (19 pins), GSM_Sheet (D10.2 FB1.2 R137.2 R145.2)
VCC: Current_Sense_Section (U1.3 U1.4 U2.3 U2.4), Reverse Protection_Section (SB40.2), Connector_Section (SB5.1 SB44.1), Controller_Section (R12.2), Valve_Section (20 pins), Temperature_Sense_Section (J34.1 J35.1 J38.1 J39.1), Sensor_Section (10 pins), LED_Section (P19.1), HMI_Encoder_NFC_Sheet (J22.7 J22.8), Ultra_Sonic_Section (J29.1), Heater_Section (16 pins)
VCC#12: Voltage_Monitoring_Section (Q32.3 R34.1 SB39.2), Regulator_Section (D11.2)
VCC#P: Voltage_Monitoring_Section (SB9.1), Reverse Protection_Section (9 pins)
ADDR-LED: Controller_Section (U21.65), LED_Section (Q26.2 R73.2)
BACKUP: Regulator_Section (C123.2 R162.1 R163.2), Controller_Section (U21.124)
BOOT0: Controller_Section (R16.1 U21.138), WIFI_Sheet (R181.2)
BUZZER: Connector_Section (R62.2), Controller_Section (U21.82)
CE: Solar_Charge_Controller (Q39.1), Controller_Section (U21.13)
CLK: Controller_Section (U21.74), SD-Card-Sheet (D22.2 J30.5 R158.1)
CMD: Controller_Section (U21.76), SD-Card-Sheet (D21.2 J30.3 R157.1)
CRNT_SNS.IP+_1: Current_Sense_Section (U1.1 U1.2), Gate_Driver_Section (D25.2 J3.2)
CRNT_SNS.IP+_2: Current_Sense_Section (U2.1 U2.2), Gate_Driver_Section (D26.2 J4.2)
CRNT_VOUT.VIOUT1: Current_Sense_Section (C11.1 R5.2 R7.1), Controller_Section (U21.28)
CRNT_VOUT.VIOUT2: Current_Sense_Section (C19.1 R8.2 R10.1), Controller_Section (U21.29)
DAC_SCL: Controller_Section (U21.11), Valve_Section (R177.1 U37.1)
DAC_SDA: Controller_Section (U21.10), Valve_Section (R176.1 U37.2)
DAT0: Controller_Section (U21.75), SD-Card-Sheet (D23.2 J30.7 R159.1)
DAT3: Controller_Section (U21.73), SD-Card-Sheet (D20.2 J30.2 R156.1)
DR_485_1: Controller_Section (U21.26), Temperature_Sense_Section (R200.1 U33.2 U33.3)
DR_485_2: Controller_Section (U21.27), Temperature_Sense_Section (R212.1 U35.2 U35.3)
DR_485_3: Controller_Section (U21.44), Temperature_Sense_Section (R201.1 U34.2 U34.3)
DR_485_4: Controller_Section (U21.45), Temperature_Sense_Section (R213.1 U36.2 U36.3)
ENA: Controller_Section (U21.7), Gate_Driver_Section (U12.2)
FILL_CNTRL: Controller_Section (U21.5), Valve_Section (Q1.1 R69.1)
FLOW_MCU1: Controller_Section (U21.79), Sensor_Section (R76.1 U8.4)
FLOW_MCU2: Controller_Section (U21.78), Sensor_Section (R35.1 U14.4)
FLOW_MCU3: Controller_Section (U21.77), Sensor_Section (R23.1 U15.4)
FLUSH_CNTRL: Controller_Section (U21.4), Valve_Section (Q2.1 R70.1)
GNSS_MCU_RX: Controller_Section (U21.97), GSM_Sheet (U26.8)
GNSS_MCU_TX: Controller_Section (U21.96), GSM_Sheet (U26.1)
GNSS_PWRCTRL: Controller_Section (U21.12), GSM_Sheet (R134.2)
GSM_PWR_EN: Controller_Section (U21.141), GSM_Sheet (R146.2)
GSM_RST: Controller_Section (U21.142), GSM_Sheet (R154.1)
HC_PWR: Receiver_Section (R170.2 U29.4), Controller_Section (U21.117)
HEAT_CNTRL: Controller_Section (U21.93), Heater_Section (R33.1)
INA_1: Controller_Section (U21.59), Gate_Driver_Section (U10.2)
INB_1: Controller_Section (U21.60), Gate_Driver_Section (U11.2)
IO_C9: Controller_Section (U21.15), Heater_Section (R28.1)
IRQ_NFC: Controller_Section (U21.139), HMI_Encoder_NFC_Sheet (J24.7)
LEVEL_MCU: Controller_Section (U21.85), Sensor_Section (R79.1 U9.4)
MCU_RX: Controller_Section (U21.102), GSM_Sheet (U23.8)
MCU_TX: Controller_Section (U21.101), GSM_Sheet (U23.1)
MEM_CNTRL: Controller_Section (U21.3), Valve_Section (Q3.1 R4.1)
MicroSD_DET: Controller_Section (U21.140), SD-Card-Sheet (D24.2 J30.SW-A R160.1)
MISO_NFC: Controller_Section (U21.134), HMI_Encoder_NFC_Sheet (J24.2)
MOSI_NFC: Controller_Section (U21.135), HMI_Encoder_NFC_Sheet (J24.3)
NRST: Connector_Section (J1.10), Controller_Section (C73.2 SW3.3 U21.25), WIFI_Sheet (R182.2)
PIR_OUT: Connector_Section (R116.2), Controller_Section (U21.99)
PM_CNTRL: Controller_Section (U21.2), Valve_Section (Q4.1 R6.1)
PS_MCU: Connector_Section (SB37.2 SB38.2), Controller_Section (U21.80)
PWM_D2: Connector_Section (Q38.3 R20.1), Controller_Section (U21.81)
RE/DE/RS485/T: Controller_Section (U21.88), Ultra_Sonic_Section (R58.1 R59.1 U24.2 U24.3)
READY: Regulator_Section (R161.1 U5.3), Controller_Section (U21.125)
RS_CNTRL: Controller_Section (U21.1), Valve_Section (Q8.1 R9.1)
RX: Receiver_Section (U28.4), Controller_Section (U21.116)
RX_HMI: Controller_Section (U21.126), HMI_Encoder_NFC_Sheet (J22.4)
RXD/RS485/RS232/T: Controller_Section (U21.87), Ultra_Sonic_Section (R57.1 U24.1)
RXIN1: Controller_Section (U21.70), Heater_Section (R91.2 R101.1)
RXIN2: Controller_Section (U21.112), Heater_Section (R92.2 R102.1)
SCK_NFC: Controller_Section (U21.133), HMI_Encoder_NFC_Sheet (J24.1)
SCL: Controller_Section (U21.136), HMI_Encoder_NFC_Sheet (J23.2)
SDA: Controller_Section (U21.137), HMI_Encoder_NFC_Sheet (J23.1)
SET: Receiver_Section (U28.5), Controller_Section (U21.118)
SHDN: Reverse Protection_Section (R64.2 SB7.2), Controller_Section (U21.14)
SNS_IN: Connector_Section (SB3.2), Controller_Section (U21.100)
SR_BR_CS: Controller_Section (R219.1), Temperature_Sense_Section (R187.1 U32.2)
SR_BR_MISO: Controller_Section (R217.1), Temperature_Sense_Section (R178.1 U32.5)
SR_BR_MOSI: Controller_Section (R218.1), Temperature_Sense_Section (R179.1 U32.4)
SR_BR_SCK: Controller_Section (R216.1), Temperature_Sense_Section (R180.1 U32.3)
SS_NFC: Controller_Section (U21.110), HMI_Encoder_NFC_Sheet (J24.4)
SW_1: Controller_Section (U21.114), Switch_Sheet (C37.2 R18.1 SW1.3)
SW_2: Controller_Section (U21.115), Switch_Sheet (C38.2 R19.1 SW2.3)
SWCLK: Connector_Section (J1.4), Controller_Section (U21.109)
SWDIO: Connector_Section (J1.2), Controller_Section (U21.105)
TEMP_SNS: Controller_Section (R31.2 U21.64), Temperature_Sense_Section (P6.2)
TX: Receiver_Section (U28.3), Controller_Section (U21.113)
TX_HMI: Controller_Section (U21.127), HMI_Encoder_NFC_Sheet (J22.5)
TXD/RS485/RS232/T: Controller_Section (U21.89), Ultra_Sonic_Section (R60.1 U24.4)
TXIN1: Controller_Section (U21.69), Heater_Section (R47.2)
TXIN2: Controller_Section (U21.111), Heater_Section (R46.2)
USB_D_N: Connector_Section (D4.2 J19.2), Controller_Section (U21.103)
USB_D_P: Connector_Section (D4.1 J19.3), Controller_Section (U21.104)
W_LED_CNTRL: Controller_Section (U21.68), LED_Section (Q25.1 R72.1)
WIFI_RX1: Controller_Section (U21.36), WIFI_Sheet (J33.7)
WIFI_TX1: Controller_Section (U21.37), WIFI_Sheet (J33.6)